# Altium project Receiver_v1.0.PrjPcb
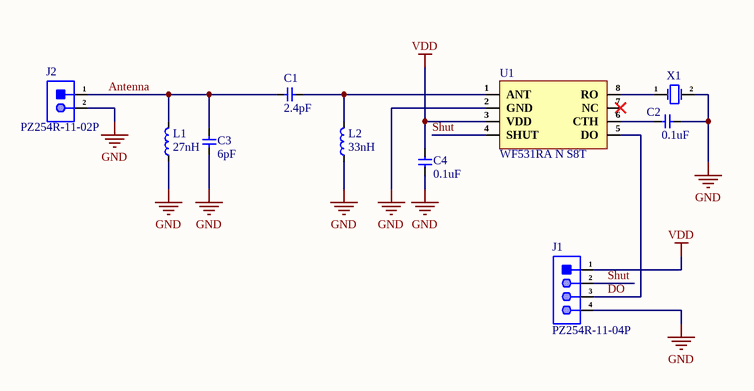
[diagram p0: Receiver_Sch_v1.0.SchDoc]
1 sheet, 10 parts. Net scope: global (net labels, ports and power ports of the same name join across sheets).
Board file: Receiver_PCB_v1.0.PcbDoc

## Sheet Receiver_Sch_v1.0.SchDoc
size A4; SheetNumber: 1; SheetTotal: 1

### Parts
C1  2.4pF  [Cap-0402]
C2  0.1uF  [Cap-0402]
C3  6pF  [Cap-0402]
C4  0.1uF  [Cap-0402]
J1  PZ254R-11-04P  [HDR1X4 (R/A Male)]
J2  PZ254R-11-02P  [HDR1X2 (R/A Male)]
L1  27nH  [IND-0603 (1608 Metric)]
L2  33nH  [IND-0402]
U1  WF531RA N S8T  [SOP-8]
X1  SXMH6.7458F2020F30  [HC-49S-SMD]  (value not drawn)

### Nets
GND: C2.2 C3.1 C4.1 J1.4 J2.2 L1.1 L2.1 U1.2(GND) X1.2(OSC2)
VDD: C4.2 J1.1 U1.3(VDD)
Antenna: C1.1 C3.2 J2.1 L1.2
DO: J1.3 U1.5(DO)
Shut: J1.2 U1.4(SHUT)
NetC1_2: C1.2 L2.2 U1.1(ANT)
NetC2_1: C2.1 U1.6(CTH)
NetU1_8: U1.8(RO) X1.1(OSC1)

Not connected (* = marked no-connect by the designer): U1 7(NC)*

### Library data of the parts
C1 = 0402CG2R4C500NT: 50V 2.4pF C0G 0402 Multilayer Ceramic Capacitors MLCC - SMD/SMT ROHS; Manufacturer: FH; Manufacturer Part Number: 0402CG2R4C500NT; Package: 0402; LCSC Part Number: C48346; Item Type: Capacitor; ComponentLink1Description: LCSC
C2 C4 = GRM155R71C104KA88D: CAP CER 0.1UF 16V X7R 0402; Manufacturer: Murata; Material: Ceramic; Value: 100nF; Tolerance: 10%; Insulation Resistance: 10GR; Item Type: Capacitor; Supplier 1: Arrow Electronics; Manufacturer Part Number: GRM155R71C104KA88D; RoHS: Yes; Category: Ceramic Capacitors; Stock 1: 1690322; Pricing 1: 10000=0.00480, 30000=0.00470, 100000=0.00350, 250000=0.00330 (USD); Mounting Technology: Surface Mount; Case/Package: 0402; Pins: 2; Case Code (Metric): 1005; Case Code (Imperial): 0402; Dielectric Material: Ceramic; Min Operating Temperature: -55°C; Max Operating Temperature: 125°C; Voltage Rating: 16V; Packaging: Tape and Reel; Voltage Rating (DC): 16V; Package Quantity: 1; Dielectric: X7R; Termination: SMD/SMT; Voltage: 16V; Series: GRM; Length: 1mm; Width: 0.02inch; Height: 0.5mm; Thickness: 0.022inch; Depth: 0.5mm; Radiation Hardening: No; Lead Free: Lead Free; RoHS Compliant: Yes; ComponentLink1URL: https://datasheet.ciiva.com/129/grm155r71c104ka88-01-129739.pdf?src-supplier=Digi-Key; ComponentLink1Description: https://datasheet.ciiva.com/129/grm155r71c104ka88-01-129739.pdf?src-supplier=Digi-Key; ComponentLink2URL: https://datasheet.ciiva.com/129/grm155r71c104ka88-01-129740.pdf?src-supplier=Digi-Key; ComponentLink2Description: https://datasheet.ciiva.com/129/grm155r71c104ka88-01-129740.pdf?src-supplier=Digi-Key; ComponentLink3URL: https://datasheet.ciiva.com/18102/getdatasheetpartid-85307-18102905.pdf?src-supplier=Verical; ComponentLink3Description: https://datasheet.ciiva.com/18102/getdatasheetpartid-85307-18102905.pdf?src-supplier=Verical; ComponentLink4URL: https://datasheet.ciiva.com/29199/454098-da-01-en-vs-kondensator-0402-29199799.pdf?src-supplier=Conrad; ComponentLink4Description: https://datasheet.ciiva.com/29199/454098-da-01-en-vs-kondensator-0402-29199799.pdf?src-supplier=Conrad; ComponentLink5URL: https://datasheet.ciiva.com/7937/4360-7937615.pdf?src-supplier=Element14; ComponentLink5Description: https://datasheet.ciiva.com/7937/4360-7937615.pdf?src-supplier=Element14; ComponentLink6URL: https://datasheet.ciiva.com/14116/grmseries-highdielectrictype-eng-14116878.pdf?src-supplier=Distrelec; ComponentLink6Description: https://datasheet.ciiva.com/14116/grmseries-highdielectrictype-eng-14116878.pdf?src-supplier=Distrelec; ComponentLink7URL: https://datasheet.ciiva.com/14103/grmseries-highdielectrictype-eng-14103750.pdf?src-supplier=Distrelec; ComponentLink7Description: https://datasheet.ciiva.com/14103/grmseries-highdielectrictype-eng-14103750.pdf?src-supplier=Distrelec; ComponentLink8URL: https://datasheet.ciiva.com/28534/4360-28534127.pdf?src-supplier=Element14; ComponentLink8Description: https://datasheet.ciiva.com/28534/4360-28534127.pdf?src-supplier=Element14; ComponentLink9URL: https://datasheet.ciiva.com/28534/4360-28534133.pdf?src-supplier=Element14; ComponentLink9Description: https://datasheet.ciiva.com/28534/4360-28534133.pdf?src-supplier=Element14; ComponentLink10URL: https://datasheet.ciiva.com/16199/product-16199000.pdf?src-supplier=Future+Electronics; ComponentLink10Description: https://datasheet.ciiva.com/16199/product-16199000.pdf?src-supplier=Future+Electronics; Supplier Part Number 1: GRM155R71C104KA88D; LCSC Part Number: C71629
C3 = 0402CG6R0C500NT: 50V 6pF C0G 0402 Multilayer Ceramic Capacitors MLCC - SMD/SMT ROHS; Manufacturer: FH (Guangdong Fenghua Advanced Tech); Manufacturer Part Number: 0402CG6R0C500NT; Package: 0402; LCSC Part Number: C1575; Item Type: Capacitor; ComponentLink1Description: LCSC
J1 = PZ254R-11-04P: Right-Angle Square Pins 2.5mm 4P 6mm -40℃~+105℃ 2.54mm Plugin Black Brass 1x4P Push-Pull,P=2.54mm Pin Headers ROHS; Manufacturer: XFCN; Item Type: R/A Male Header; Manufacturer Part Number: PZ254R-11-04P; Package: Push-Pull,P=2.54mm; LCSC Part Number: C492412; ComponentLink1Description: LCSC; ComponentLink1URL: https://www.lcsc.com/product-detail/Pin-Headers_XFCN-PZ254R-11-04P_C492412.html
J2 = PZ254R-11-02P: Right-Angle Square Pins 2.5mm 2P 6mm -40℃~+105℃ 2.54mm Plugin Black Brass 1x2P Push-Pull,P=2.54mm Pin Headers ROHS; Manufacturer: XFCN; Item Type: R/A Male Header; Manufacturer Part Number: PZ254R-11-02P; Package: Push-Pull,P=2.54mm; LCSC Part Number: C492410; ComponentLink1Description: LCSC; ComponentLink1URL: https://www.lcsc.com/product-detail/Pin-Headers_XFCN-PZ254R-11-02P_C492410.html
L1 = LQW18AN27NG10D: FIXED IND 27NH 590MA 116MOHM SMD; Manufacturer: Murata; Core Material: Non-Magnetic; Tolerance: 2%; DC Resistance (DCR): 116mR; Shielding: Unshielded; Self Resonant Frequency: 2.8GHz; Q Factor: 42; Test Frequency: 100MHz; Item Type: Inductor; Supplier 1: Arrow Electronics; Manufacturer Part Number: LQW18AN27NG10D; RoHS: Yes; Category: Fixed Inductors; Stock 1: 3528; Pricing 1: 1=0.17550, 10=0.13260, 25=0.13120, 100=0.10470, 250=0.09530, 500=0.08580, 1000=0.07160, 3000=0.06500 (USD); Mount: Surface Mount; Case/Package: 0603; Weight: 0.000106oz; Case Code (Metric): 1608; Case Code (Imperial): 0603; Min Operating Temperature: -55°C; Max Operating Temperature: 125°C; Inductance: 27nH; Packaging: Tape and Reel; Max DC Current: 590mA; Inductance Tolerance: 2%; Package Quantity: 1; Current Rating: 590mA; Resistor Type: Wirewound; Termination: SMD/SMT; DC Current: 590mA; Series: LQW18A_10; Length: 1.6mm; Width: 0.031inch; Height: 0.8mm; Depth: 1.1mm; Height - Seated (Max): 0.039inch; Radiation Hardening: No; Lead Free: Lead Free; Military Standard: Not; Reach SVHC Compliant: Yes; RoHS Compliant: Yes; ComponentLink1URL: https://datasheet.ciiva.com/11799/0900766b80a002db-11799175.pdf?src-supplier=RSComponents; ComponentLink1Description: https://datasheet.ciiva.com/11799/0900766b80a002db-11799175.pdf?src-supplier=RSComponents; ComponentLink2URL: https://datasheet.ciiva.com/6705/l0075s0080lqw18a-10-6705574.pdf?src-supplier=Digi-Key; ComponentLink2Description: https://datasheet.ciiva.com/6705/l0075s0080lqw18a-10-6705574.pdf?src-supplier=Digi-Key; ComponentLink3URL: https://datasheet.ciiva.com/8507/l0075s0080lqw18a-10-8507510.pdf?src-supplier=Avnet; ComponentLink3Description: https://datasheet.ciiva.com/8507/l0075s0080lqw18a-10-8507510.pdf?src-supplier=Avnet; ComponentLink4URL: https://datasheet.ciiva.com/4978/product-4978252.pdf?src-supplier=Mouser; ComponentLink4Description: https://datasheet.ciiva.com/4978/product-4978252.pdf?src-supplier=Mouser; Supplier Part Number 1: LQW18AN27NG10D; LCSC Part Number: C701182
L2 = LQG15HN33NH02D: 300mA 33nH ±3% 670mΩ 0402 Inductors (SMD) ROHS; Manufacturer: Murata Electronics; Manufacturer Part Number: LQG15HN33NH02D; Package: 0402; LCSC Part Number: C2044267; Item Type: Inductor; ComponentLink1Description: LCSC; ComponentLink1URL: https://www.lcsc.com/product-detail/Inductors-SMD_Murata-Electronics-LQG15HN33NH02D_C2044267.html
U1 = WF531RA N S8T: SOP-8 RF Transceiver ICs ROHS; Manufacturer: WF; Item type: IC; Manufacturer Part Number: WF531RA N S8T; Package: SOP-8; LCSC Part Number: C2886629
X1 = SXMH6.7458F2020F30: 6.7458MHz 20pF ±20ppm HC-49S-SMD Crystals ROHS; Manufacturer: Shenzhen SCTF Elec; Manufacturer Part Number: SXMH6.7458F2020F30; Package: HC-49S-SMD; LCSC Part Number: C2901748; Item Type: Crystals; ComponentLink1Description: LCSC; ComponentLink1URL: https://www.lcsc.com/product-detail/Crystals_Shenzhen-SCTF-Elec-SXMH6-7458F2020F30_C2901748.html